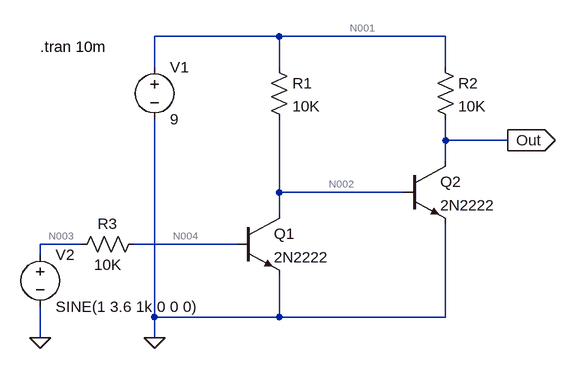
[diagram p0: schematic GATE.asc]
GATE.asc, the LTspice schematic file:
Version 4
SHEET 1 880 680
WIRE 320 -224 128 -224
WIRE 576 -224 320 -224
WIRE 128 -176 128 -224
WIRE 320 -176 320 -224
WIRE 576 -176 576 -224
WIRE 576 -64 576 -96
WIRE 672 -64 576 -64
WIRE 576 -32 576 -64
WIRE 320 16 320 -96
WIRE 512 16 320 16
WIRE 320 48 320 16
WIRE 16 96 -48 96
WIRE 256 96 96 96
WIRE -48 112 -48 96
WIRE 128 208 128 -96
WIRE 320 208 320 144
WIRE 320 208 128 208
WIRE 576 208 576 64
WIRE 576 208 320 208
WIRE -48 240 -48 192
WIRE 128 240 128 208
FLAG 128 240 0
FLAG 672 -64 Out
IOPIN 672 -64 Out
FLAG -48 240 0
SYMBOL voltage 128 -192 R0
WINDOW 123 0 0 Left 0
WINDOW 39 0 0 Left 0
SYMATTR InstName V1
SYMATTR Value 9
SYMBOL npn 256 48 R0
SYMATTR InstName Q1
SYMATTR Value 2N2222
SYMBOL npn 512 -32 R0
SYMATTR InstName Q2
SYMATTR Value 2N2222
SYMBOL res 304 -192 R0
SYMATTR InstName R1
SYMATTR Value 10K
SYMATTR SpiceLine tol=1 pwr=0.1
SYMBOL res 560 -192 R0
SYMATTR InstName R2
SYMATTR Value 10K
SYMATTR SpiceLine tol=1 pwr=0.1
SYMBOL res 112 80 R90
WINDOW 0 0 56 VBottom 2
WINDOW 3 32 56 VTop 2
SYMATTR InstName R3
SYMATTR Value 10K
SYMATTR SpiceLine tol=1 pwr=0.1
SYMBOL voltage -48 96 R0
WINDOW 123 24 124 Left 2
WINDOW 39 0 0 Left 0
SYMATTR InstName V2
SYMATTR Value SINE(1 3.6 1k 0 0 0)
TEXT -48 -208 Left 2 !.tran 10m

The netlist it stands for:
* GATE.asc
V1 N001 0 9
Q1 N002 N004 0 0 2N2222
Q2 Out N002 0 0 2N2222
R1 N001 N002 10K tol=1 pwr=0.1
R2 N001 Out 10K tol=1 pwr=0.1
R3 N004 N003 10K tol=1 pwr=0.1
V2 N003 0 SINE(1 3.6 1k 0 0 0)
.model NPN NPN
.model PNP PNP
.lib standard.bjt
.tran 10m
.backanno
.end

* Results of the author's LTspice run, read from the files saved beside the schematic
* Operating Point, zero values left out:
*   V(n001) = 9 V
*   V(n002) = 63.85 mV
*   V(n004) = 656.1 mV
*   V(out) = 9 V
*   V(n003) = 1 V
*   Ic(Q1) = 893.6 µA
*   Ib(Q1) = 34.39 µA
*   Ie(Q1) = -928 µA
*   Ic(Q2) = 9.065 pA
*   Ib(Q2) = -8.875 pA
*   I(R1) = 893.6 µA
*   I(R2) = 9.067 pA
*   I(R3) = -34.39 µA
*   I(V1) = -893.6 µA
*   I(V2) = -34.39 µA
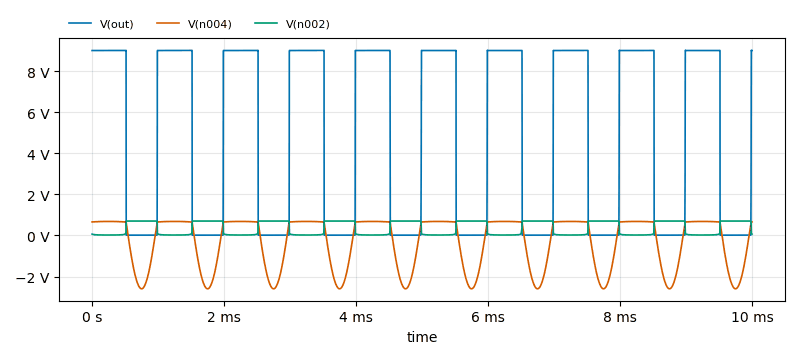
[diagram p1: Transient Analysis of GATE.asc, plotted from the saved traces]
* Transient Analysis, 1 run:
*   V(out): min 14.61 mV, max 9.008 V, average 4.767 V, rms 6.541 V, last 9 V
*   V(n004): min -2.597 V, max 682.3 mV, average -312.9 mV, rms 1.29 V, last 655.9 mV
*   V(n002): min 20.19 mV, max 700.7 mV, average 347.6 mV, rms 482 mV, last 64.11 mV